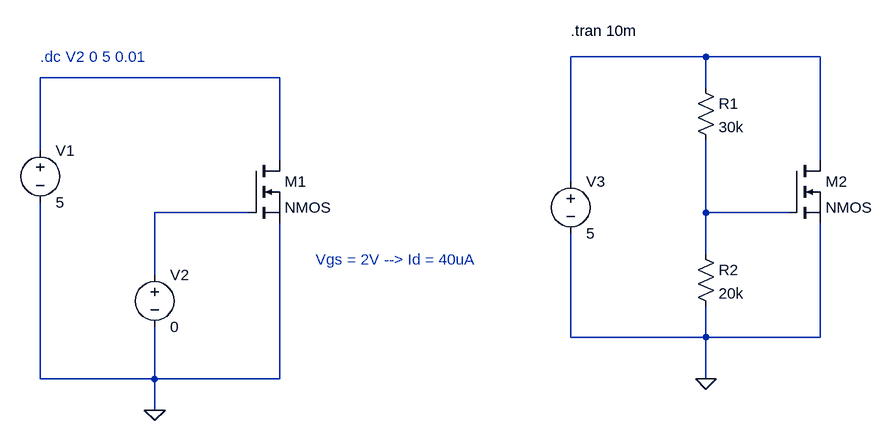
[diagram p0: schematic CL2_T7_BiasingA_MOSFET_Transistor.asc]
CL2_T7_BiasingA_MOSFET_Transistor.asc, the LTspice schematic file:
Version 4.1
SHEET 1 880 680
WIRE -1184 -320 -1392 -320
WIRE -1008 -320 -1184 -320
WIRE -1840 -288 -2208 -288
WIRE -1184 -272 -1184 -320
WIRE -2208 -176 -2208 -288
WIRE -1840 -160 -1840 -288
WIRE -1008 -160 -1008 -320
WIRE -1392 -128 -1392 -320
WIRE -1888 -80 -2032 -80
WIRE -1184 -80 -1184 -192
WIRE -1056 -80 -1184 -80
WIRE -1184 -16 -1184 -80
WIRE -2032 16 -2032 -80
WIRE -1392 112 -1392 -48
WIRE -1184 112 -1184 64
WIRE -1184 112 -1392 112
WIRE -1008 112 -1008 -64
WIRE -1008 112 -1184 112
WIRE -2208 176 -2208 -96
WIRE -2032 176 -2032 96
WIRE -2032 176 -2208 176
WIRE -1840 176 -1840 -64
WIRE -1840 176 -2032 176
WIRE -1184 176 -1184 112
WIRE -2032 224 -2032 176
FLAG -2032 224 0
FLAG -1184 176 0
SYMBOL voltage -2208 -192 R0
WINDOW 123 0 0 Left 0
WINDOW 39 0 0 Left 0
SYMATTR InstName V1
SYMATTR Value 5
SYMBOL voltage -2032 0 R0
WINDOW 123 0 0 Left 0
WINDOW 39 0 0 Left 0
SYMATTR InstName V2
SYMATTR Value 0
SYMBOL nmos -1888 -160 R0
SYMATTR InstName M1
SYMBOL res -1200 -288 R0
SYMATTR InstName R1
SYMATTR Value 30k
SYMBOL res -1200 -32 R0
SYMATTR InstName R2
SYMATTR Value 20k
SYMBOL nmos -1056 -160 R0
SYMATTR InstName M2
SYMBOL voltage -1392 -144 R0
WINDOW 123 0 0 Left 0
WINDOW 39 0 0 Left 0
SYMATTR InstName V3
SYMATTR Value 5
TEXT -2208 -320 Left 2 ;.dc V2 0 5 0.01
TEXT -1784 -8 Left 2 ;Vgs = 2V --> Id = 40uA
TEXT -1392 -360 Left 2 !.tran 10m

The netlist it stands for:
* CL2_T7_BiasingA_MOSFET_Transistor.asc
V1 N002 0 5
V2 N003 0 0
M1 N002 N003 0 0 NMOS
R1 N001 N004 30k
R2 N004 0 20k
M2 N001 N004 0 0 NMOS
V3 N001 0 5
.model NMOS NMOS
.model PMOS PMOS
.lib standard.mos
* .dc V2 0 5 0.01
* Vgs = 2V --> Id = 40uA
.tran 10m
.backanno
.end